# EasyEDA Pro project realtix-sakura_nfc-d968f2f9.epro, schematic Schematic1
Board Name: 库洛牌_无丝印; Create Date: 2025-03-24; Page Name: P1; Project Name: 小樱nfc鸟头杖; Schematic Name: Schematic1; Update Date: 2025-03-24; Company: 嘉立创EDA; Page Size: A4; Version: V1.0
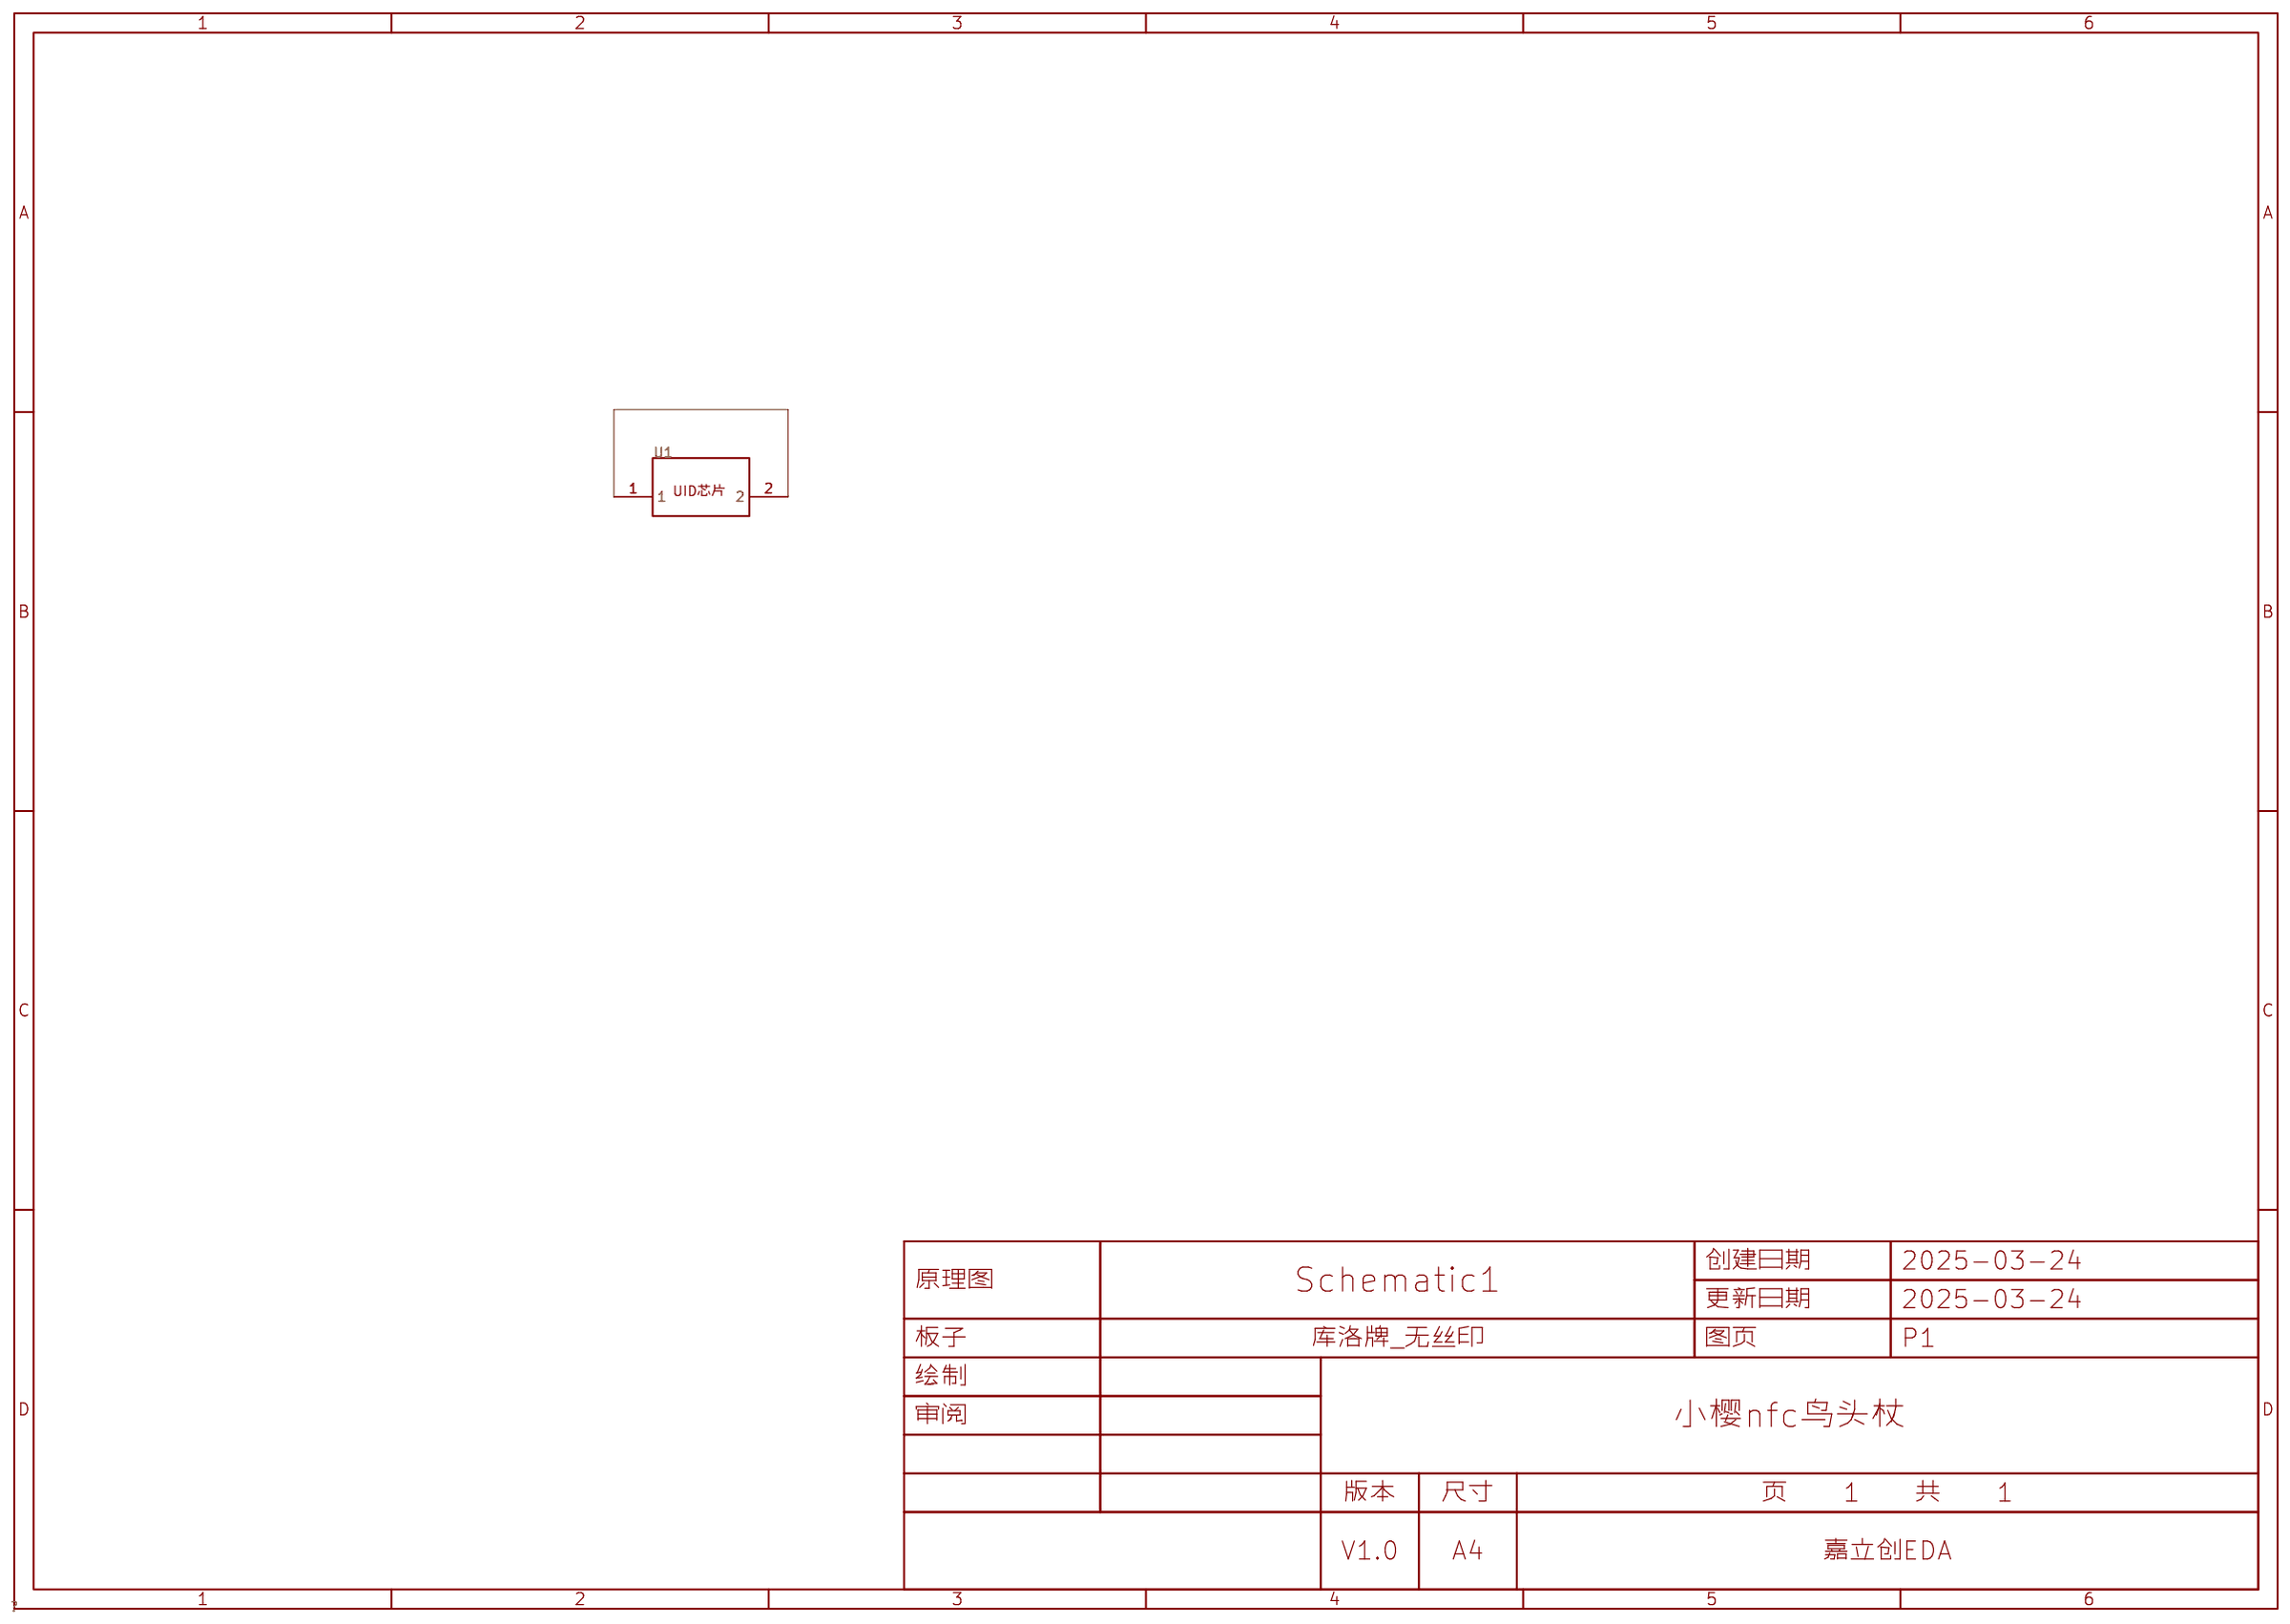
[diagram p0: schematic sheet]

## Parts
U1  -  [CUID-5X8]

## Library data of the parts
U1 = CUID-5X8

## Nets
$1N113: U1.1 U1.2
